# Altium schematic sheet ModuMIDI_Connectors_GPIO.SchDoc
size A; SheetNumber: 3; SheetTotal: 3
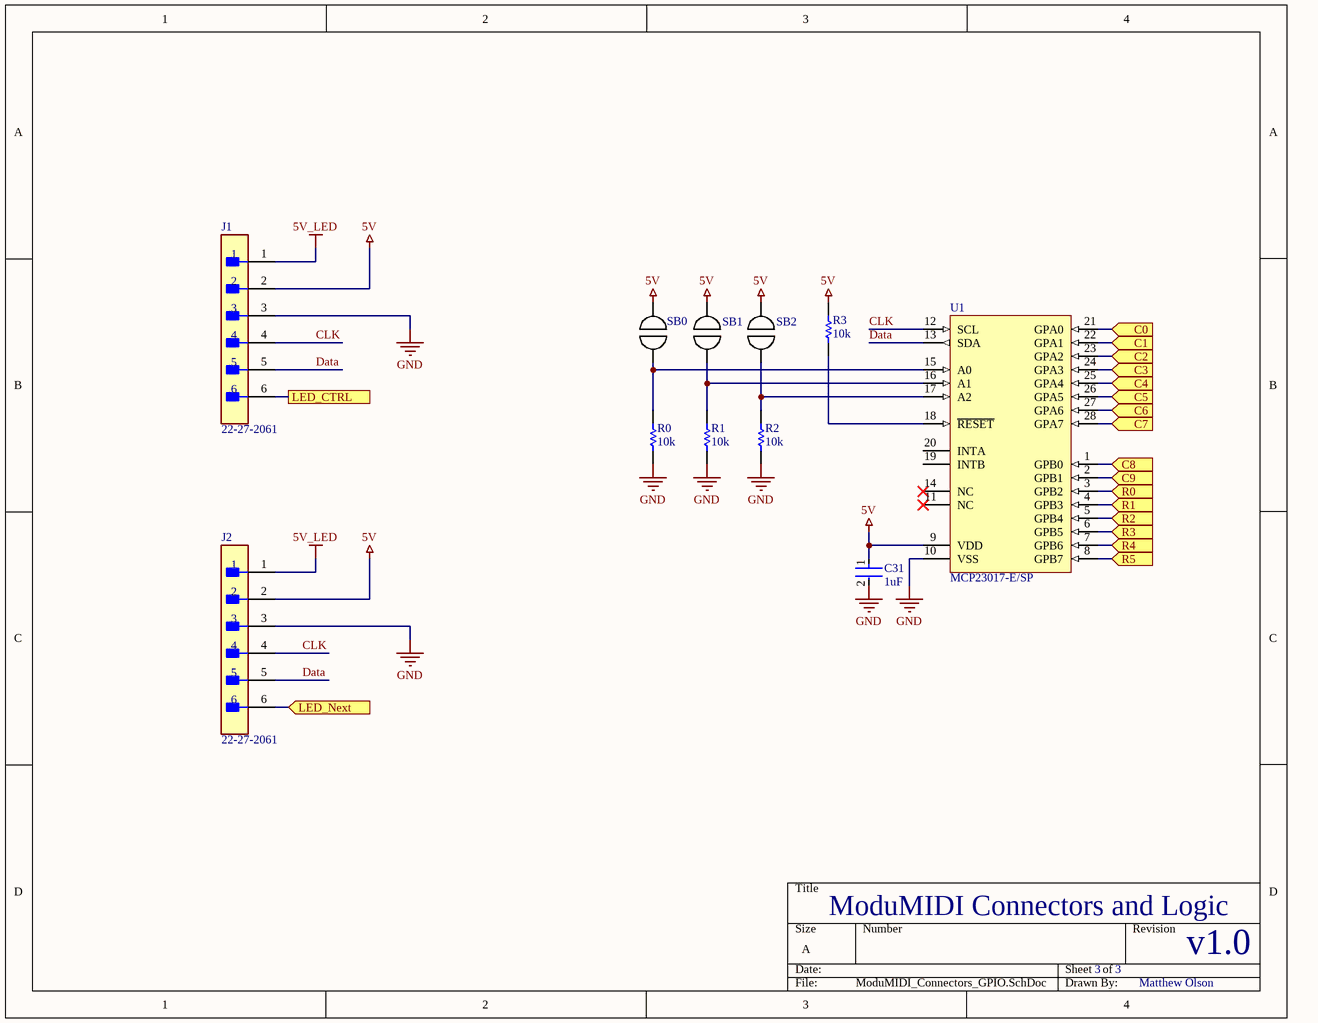
[diagram p0: ModuMIDI_Connectors_GPIO.SchDoc]

## Parts
C31  1uF  [FP-CC0805-0_85-MFG]
J1  22-27-2061  [FP-22-27-2061-MFG]
J2  22-27-2061  [FP-22-27-2061-MFG]
R0  10k  [RESC2013X60X35NL10T20]
R1  10k  [RESC2013X60X35NL10T20]
R2  10k  [RESC2013X60X35NL10T20]
R3  10k  [RESC2013X60X35NL10T20]
SB0  Solder_Bridge_Open  [PCBComponent_1]  (value not drawn)  (net tie, no BOM)
SB1  Solder_Bridge_Open  [PCBComponent_1]  (value not drawn)  (net tie, no BOM)
SB2  Solder_Bridge_Open  [PCBComponent_1]  (value not drawn)  (net tie, no BOM)
U1  MCP23017-E/SP  [SPDIP300-SP28]

## Ports
C0 (in), C1 (in), C2 (in), C3 (in), C4 (in), C5 (in), C6 (in), C7 (in), C8 (in), C9 (in), LED_CTRL, LED_Next (in), R0 (in), R1 (in), R2 (in), R3 (in), R4 (in), R5 (in)

## Nets
5V: C31.1 J1.2 J2.2 R3.2 SB0.2 SB1.2 SB2.2 U1.9(VDD)
5V_LED: J1.1 J2.1
GND: C31.2 J1.3 J2.3 R0.1 R1.1 R2.1 U1.10(VSS)
C0: U1.21(GPA0) ; port C0
C1: U1.22(GPA1) ; port C1
C2: U1.23(GPA2) ; port C2
C3: U1.24(GPA3) ; port C3
C4: U1.25(GPA4) ; port C4
C5: U1.26(GPA5) ; port C5
C6: U1.27(GPA6) ; port C6
C7: U1.28(GPA7) ; port C7
C8: U1.1(GPB0) ; port C8
C9: U1.2(GPB1) ; port C9
CLK: J1.4 J2.4 U1.12(SCL)
Data: J1.5 J2.5 U1.13(SDA)
LED_CTRL: J1.6 ; port LED_CTRL
LED_Next: J2.6 ; port LED_Next
R0: U1.3(GPB2) ; port R0
R1: U1.4(GPB3) ; port R1
R2: U1.5(GPB4) ; port R2
R3: U1.6(GPB5) ; port R3
R4: U1.7(GPB6) ; port R4
R5: U1.8(GPB7) ; port R5
NetR0_2: R0.2 SB0.1 U1.15(A0)
NetR1_2: R1.2 SB1.1 U1.16(A1)
NetR2_2: R2.2 SB2.1 U1.17(A2)
NetR3_1: R3.1 U1.18(~{RESET})

Not connected (* = marked no-connect by the designer): U1 11(NC)* 14(NC)* 19(INTB) 20(INTA)

## Notes on the sheet
- ModuMIDI Connectors and Logic
- 3
- v1.0
- Matthew Olson

## Library data of the parts
C31 = CMP-03422-000182-1: CAP CER 1UF 10V X7R 0805; Manufacturer: Yageo; Manufacturer Part Number: CC0805KKX7R6BB105; Material: Ceramic; Tolerance: 0.1; Value: 1 uF; ComponentLink2URL: http://www.yageo.com/documents/recent/UPY-GPHC_Y5V_6.3V-to-50V_8.pdf; Automotive: No; Temperature Range Low: -30°C; Octopart: https://octopart.com/cc0805kkx7r6bb105-yageo-42522859; Temperature Characteristic: X7R; RoHS: TRUE; Voltage Rating: 10 V; Capacitance: 1 uF; Package: CC0805-0.85; Device Class L3: Ceramic Capacitors; Category: Cap; Mouser Description: Multilayer Ceramic Capacitors MLCC - SMD/SMT 1.0uF 10V X7R 10%; Temperature Range High: +85°C; Ipc Land Pattern Name: CAPC200125X85; ComponentLink2Description: Datasheet; Temperature: -30°C to +85°C; Height: 0.95mm; Lead Free: Yes; Device Class L1: Passive Components; Device Class L2: Capacitors; Footprint Url: http://www.yageo.com/exep/pages/download/literatures/UPY-C_GEN_24.pdf; Digikey Description: CAP CER 1UF 10V X7R 0805; PN: CC0805KKX7R6BB105
J1 J2 = CMP-04776-000309-1: CONN HEADER VERT 6POS 2.54MM; Number of Contacts: 6; Current Rating: 4A; Voltage Rating (AC): 250V; Contact Resistance: 10mR; Hole Diameter: 1.02mm; Connector Type: Male Pin; Gender: Male; Mount: Through Hole; REACH SVHC: No SVHC; Number of Rows: 1; Contact Plating: Tin; Series: KK; Depth: 5.8mm; Flammability Rating: UL94 V-0; Contact Type: Male Pin; Lead Pitch: 2.54mm; Min Operating Temperature: 0°C; Pitch: 2.54mm; Radiation Hardening: No; Color: Natural; Length: 15.24mm; Termination: Solder; Orientation: Straight; Contact Material: Brass; Max Voltage Rating (AC): 250V; Housing Material: Nylon; Max Operating Temperature: 75°C; Working Voltage: 250V; Max Current Rating: 4A; Fastening Type: Friction; Voltage Rating: 250V; Housing Color: White; Packaging: Bulk; Material: Nylon; Contact Mating Length: 0.295inch; Package Quantity: 10000; Number of Positions: 6
R0-R3 = CMP-1659-00013-4: Chip Resistor, 10 KOhm, +/- 1%, 0.125 W, -55 to 155 degC, 0805 (2012 Metric), RoHS, Tape and Reel / RC0805FR-0710KL; Manufacturer: Yageo; Voltage Rating: 150 V; Mount: Surface Mount; ComponentLink1Description: Manufacturer URL; ComponentLink2URL: http://www.yageo.com/documents/recent/PYu-RC_Group_51_RoHS_L_04.pdf; Pins: 2; Length: 2 mm; Min Operating Temperature: -55 degC; Height: 0.5 mm; Mounting Technology: Surface Mount; RoHSCompliant: true; REACH SVHC: No SVHC; ComponentLink1URL: http://www.yageo.com/; Max Operating Temperature: 155 degC; PackageReference: 0805; DatasheetVersion: Rev. 4, 02/2016; Package Quantity: 5000; Packaging: Tape and Reel; ComponentLink2Description: Datasheet; PackageDescription: 2-Pin Surface Mounted Device, Body 2 x 1.25 mm; PN: RC0805FR-0710KL
SB0-SB2 = Solder_Bridge_Open: Normally open solder bridge
U1 = CMP-0186-00081-2: 16-Bit I/O Expander with Serial Interface, 28-Pin SPDIP, Extended Temperature; RevisionNote: URLs added.; ComponentLink3Description: Package Specification; PackageVersion: revBB, Aug-2009; ComponentLink1Description: Manufacturer URL; DatasheetVersion: revB, Feb-2007; PackageDescription: 28-Lead Skinny Plastic Dual In-Line (SP) - 300 mil Body [SPDIP]; ComponentLink1URL: http://www.microchip.com/; PackageReference: SPDIP300-SP28; ComponentLink3URL: http://www.microchip.com/stellent/groups/techpub_sg/documents/packagingspec/en012702.pdf; ComponentLink2Description: Datasheet; ComponentLink2URL: http://ww1.microchip.com/downloads/en/DeviceDoc/21952b.pdf